# Altium schematic sheet VOCT_AMPS.SchDoc
size A4; SheetNumber: 2; SheetTotal: 4
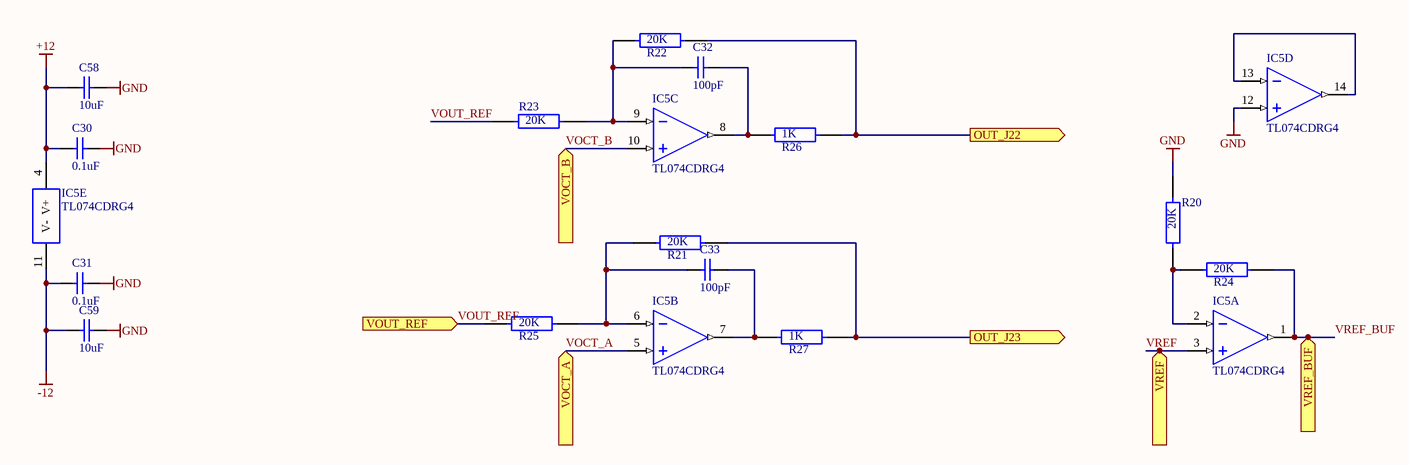
[diagram p0: VOCT_AMPS.SchDoc]

## Parts
C30  0.1uF  [CAPC2013X145X48NL20T23]
C31  0.1uF  [CAPC2013X145X48NL20T23]
C32  100pF  [CAPC2013X145X48NL20T23]
C33  100pF  [CAPC2013X145X48NL20T23]
C58  10uF  [CAPC2013X145X48NL20T23]
C59  10uF  [CAPC2013X145X48NL20T23]
IC5  TL074CDRG4  [tl074]  (parts A,B,C,D,E of 5)
R20  20K  [FP-RN73R2A-IPC_A]
R21  20K  [FP-RN73R2A-IPC_A]
R22  20K  [FP-RN73R2A-IPC_A]
R23  20K  [FP-RN73R2A-IPC_A]
R24  20K  [FP-RN73R2A-IPC_A]
R25  20K  [FP-RN73R2A-IPC_A]
R26  1K  [FP-RN73R2A-IPC_A]
R27  1K  [FP-RN73R2A-IPC_A]

## Ports
OUT_J22, OUT_J23, VOCT_A, VOCT_B, VOUT_REF, VREF, VREF_BUF

## Nets
+12: C30.2 C58.2 IC5.4(V+)
-12: C31.2 C59.2 IC5.11(V-)
GND: C30.1 C31.1 C58.1 C59.1 IC5.12(IN4+) R20.1
OUT_J22: R22.1 R26.1 ; port OUT_J22
OUT_J23: R21.1 R27.1 ; port OUT_J23
VOCT_A: IC5.5(IN2+) ; port VOCT_A
VOCT_B: IC5.10(IN3+) ; port VOCT_B
VOUT_REF: R23.1 R25.2 ; port VOUT_REF
VREF: IC5.3(IN1+) ; port VREF
VREF_BUF: IC5.1(OUT1) R24.1 ; port VREF_BUF
NetC32_1: C32.1 IC5.8(OUT3) R26.2
NetC32_2: C32.2 IC5.9(IN3-) R22.2 R23.2
NetC33_1: C33.1 IC5.7(OUT2) R27.2
NetC33_2: C33.2 IC5.6(IN2-) R21.2 R25.1
NetIC5_2: IC5.2(IN1-) R20.2 R24.2
NetIC5_13: IC5.13(IN4-) IC5.14(OUT4)

## Library data of the parts
C30-C33 C58 C59 = CAP: Manufacturer: Vitramon; Part Number: VJ0805Y682KXAMT
IC5 = tl074: Quad Low-Noise JFET-Input General-Purpose Operational Amplifier, 7 to 36 V, 0 to 70 degC, 14-pin SOIC (D14), Green (RoHS & no Sb/Br); Manufacturer: Texas Instruments; GBW(Typ)(MHz): 3; Sub Family: General Purpose Amplifier, High Supply Voltage Amplifier (>=30V); Vn at 1kHz(Typ)(nV/rtHz): 18; Rating: Military; Total Supply Voltage(Min)(+5V is 5, +/-5V is 10): 7; IIB(Max)(pA): 200; CMRR(Min)(dB): 70; Number of Channels: 4; Vio (25C)(Max)(mV): 10; Slew Rate(Typ)(V/us): 13; Iq per channel(Max)(mA): 2.5; Total Supply Voltage(Max)(+5V is 5, +/-5V is 10): 36; ComponentLink2URL: http://www.ti.com/lit/ds/symlink/tl074.pdf; ComponentLink3Description: Package Specification; PackageReference: D0014A; ComponentLink1URL: http://www.ti.com/; PartNumber: TL074CDRG4; PackageVersion: 4040047-5/M, 06/2011; Eco-Plan: Green (RoHS & no Sb/Br); PackageDescription: 14-Pin Plastic Small Outline, Body 8.65 x 3.90 mm, Pitch 1.27 mm; Mounting Technology: Surface Mount; ComponentLink1Description: Manufacturer URL; Offset Drift(Typ)(uV/C): 18; ComponentLink3URL: http://www.ti.com/lit/ml/mpds177g/mpds177g.pdf; ComponentLink2Description: Datasheet; DatasheetVersion: SLOS080J; Code_JEDEC: MS-012
R20-R27 = Resistor: RES 10K OHM 0.1% 1/8W 0805